# Altium schematic sheet SDIO_SDMMC_Sheet.SchDoc
size A4; DocumentNumber: 18; SheetNumber: 18; SheetTotal: 27
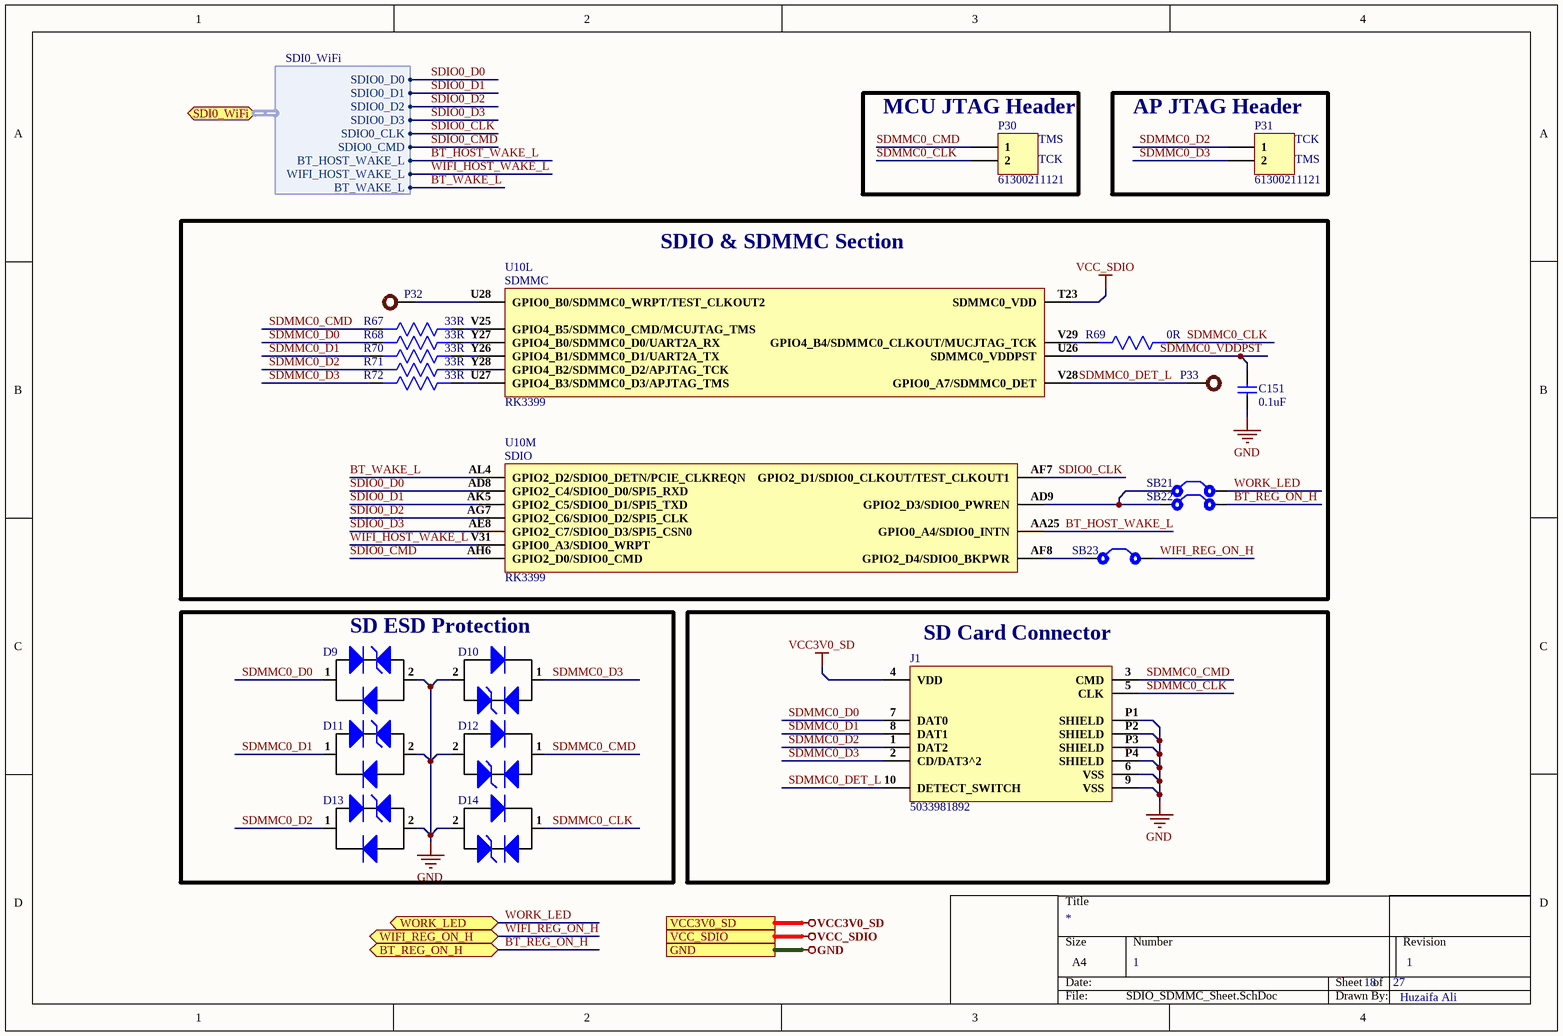
[diagram p0: SDIO_SDMMC_Sheet.SchDoc]

## Parts
C151  0.1uF  [Cap0402]
D9  ESD9X5VU  [DFN1006-2L]  (value not drawn)
D10  ESD9X5VU  [DFN1006-2L]  (value not drawn)
D11  ESD9X5VU  [DFN1006-2L]  (value not drawn)
D12  ESD9X5VU  [DFN1006-2L]  (value not drawn)
D13  ESD9X5VU  [DFN1006-2L]  (value not drawn)
D14  ESD9X5VU  [DFN1006-2L]  (value not drawn)
J1  5033981892  [503398-1892]
P30  61300211121  [HDR1X2]
P31  61300211121  [HDR1X2]
P32  Test Point  [TEST POINT]  (value not drawn)
P33  TEST POINT  [TEST POINT]  (value not drawn)
R67  33R  [Res0603]
R68  33R  [Res0603]
R69  0R  [Res0603]
R70  33R  [Res0603]
R71  33R  [Res0603]
R72  33R  [Res0603]
SB21  Solder Bridge  [Solder Bridge]  (value not drawn)
SB22  Solder Bridge  [Solder Bridge]  (value not drawn)
SB23  Solder Bridge  [Solder Bridge]  (value not drawn)
U10  RK3399  [RK3399]  (parts L,M of 34)

## Blocks framed on the sheet
MCU JTAG Header: P30
AP JTAG Header: P31
SDIO & SDMMC Section: C151 P32 P33 R67-R72 SB21-SB23 U10
SD ESD Protection: D9-D14
SD Card Connector: J1

## Ports
BT_REG_ON_H (bidir), GND, SDI0_WiFi (bidir, harness SDI0_WiFi), VCC3V0_SD, VCC_SDIO, WIFI_REG_ON_H (bidir), WORK_LED (bidir)

## Harnesses
SDI0_WiFi: SDIO0_D0, SDIO0_D1, SDIO0_D2, SDIO0_D3, SDIO0_CLK, SDIO0_CMD, BT_HOST_WAKE_L, WIFI_HOST_WAKE_L, BT_WAKE_L

## Nets
GND: C151.1 D9.2 D10.2 D11.2 D12.2 D13.2 D14.2 J1.6(VSS) J1.9(VSS) J1.P1(SHIELD) J1.P2(SHIELD) J1.P3(SHIELD) J1.P4(SHIELD) ; port GND
VCC3V0_SD: J1.4(VDD) ; port VCC3V0_SD
VCC_SDIO: U10.T23(SDMMC0_VDD) ; port VCC_SDIO
BT_HOST_WAKE_L: U10.AA25(GPIO0_A4/SDIO0_INTN) ; port SDI0_WiFi.BT_HOST_WAKE_L
BT_REG_ON_H: SB22.2 ; port BT_REG_ON_H
BT_WAKE_L: U10.AL4(GPIO2_D2/SDIO0_DETN/PCIE_CLKREQN) ; port SDI0_WiFi.BT_WAKE_L
SDIO0_CLK: U10.AF7(GPIO2_D1/SDIO0_CLKOUT/TEST_CLKOUT1) ; port SDI0_WiFi.SDIO0_CLK
SDIO0_CMD: U10.AH6(GPIO2_D0/SDIO0_CMD) ; port SDI0_WiFi.SDIO0_CMD
SDIO0_D0: U10.AD8(GPIO2_C4/SDIO0_D0/SPI5_RXD) ; port SDI0_WiFi.SDIO0_D0
SDIO0_D1: U10.AK5(GPIO2_C5/SDIO0_D1/SPI5_TXD) ; port SDI0_WiFi.SDIO0_D1
SDIO0_D2: U10.AG7(GPIO2_C6/SDIO0_D2/SPI5_CLK) ; port SDI0_WiFi.SDIO0_D2
SDIO0_D3: U10.AE8(GPIO2_C7/SDIO0_D3/SPI5_CSN0) ; port SDI0_WiFi.SDIO0_D3
SDMMC0_CLK: D14.1 J1.5(CLK) P30.2 R69.1
SDMMC0_CMD: D12.1 J1.3(CMD) P30.1 R67.2
SDMMC0_D0: D9.1 J1.7(DAT0) R68.2
SDMMC0_D1: D11.1 J1.8(DAT1) R70.2
SDMMC0_D2: D13.1 J1.1(DAT2) P31.1 R71.2
SDMMC0_D3: D10.1 J1.2(CD/DAT3^2) P31.2 R72.2
SDMMC0_DET_L: J1.10(DETECT_SWITCH) P33.1 U10.V28(GPIO0_A7/SDMMC0_DET)
SDMMC0_VDDPST: C151.2 U10.U26(SDMMC0_VDDPST)
WIFI_HOST_WAKE_L: U10.V31(GPIO0_A3/SDIO0_WRPT) ; port SDI0_WiFi.WIFI_HOST_WAKE_L
WIFI_REG_ON_H: SB23.2 ; port WIFI_REG_ON_H
WORK_LED: SB21.2 ; port WORK_LED
NetP32_1: P32.1 U10.U28(GPIO0_B0/SDMMC0_WRPT/TEST_CLKOUT2)
NetR67_1: R67.1 U10.V25(GPIO4_B5/SDMMC0_CMD/MCUJTAG_TMS)
NetR68_1: R68.1 U10.Y27(GPIO4_B0/SDMMC0_D0/UART2A_RX)
NetR69_2: R69.2 U10.V29(GPIO4_B4/SDMMC0_CLKOUT/MUCJTAG_TCK)
NetR70_1: R70.1 U10.Y26(GPIO4_B1/SDMMC0_D1/UART2A_TX)
NetR71_1: R71.1 U10.Y28(GPIO4_B2/SDMMC0_D2/APJTAG_TCK)
NetR72_1: R72.1 U10.U27(GPIO4_B3/SDMMC0_D3/APJTAG_TMS)
NetSB21_1: SB21.1 SB22.1 U10.AD9(GPIO2_D3/SDIO0_PWREN)
NetSB23_1: SB23.1 U10.AF8(GPIO2_D4/SDIO0_BKPWR)

## Notes on the sheet
- (near P30) TMS
- (near P30) TCK
- (near P31) TCK
- (near P31) TMS
- 1
- Huzaifa Ali
- (in symbol RK3399, part L) SDMMC
- (in symbol RK3399, part M) SDIO

## Library data of the parts
C151 = CC0402KRX5R6BB104: CAP CER 0.1UF 10V X5R 0402; Manufacturer: Yageo; Capacitance: 100nF; Tolerance: 10%; Dissipation Factor: 5%; Insulation Resistance: 10GR; Supplier 1: Digi-Key; Manufacturer Part Number: CC0402KRX5R6BB104; RoHS: Yes; Category: Ceramic Capacitors; Stock 1: 6385580; Pricing 1: 1=0.10000, 10=0.02700, 50=0.01500, 100=0.01220, 500=0.00874, 1000=0.00687, 2500=0.00625, 5000=0.00575 (USD); Mount: Surface Mount; Case/Package: 0402; Number of Pins: 2; Case Code (Imperial): 0402; Case Code (Metric): 1005; Min Operating Temperature: -55°C; Max Operating Temperature: 85°C; Dielectric: X5R; Packaging: Tape and Reel; Voltage Rating: 10V; Package Quantity: 1; Termination: SMD/SMT; Voltage Rating (DC): 10V; Series: CC; Length: 1mm; Width: 0.02inch; Height: 0.5mm; Depth: 0.5mm; Thickness: 0.022inch; Radiation Hardening: No; RoHS Compliant: Yes; REACH SVHC: No SVHC; Lead Free: Lead Free; Halogen Free: Halogen Free; ComponentLink1URL: https://datasheet.ciiva.com/144/mlccorderingcode-144029.pdf?src-supplier=Digi-Key; ComponentLink1Description: https://datasheet.ciiva.com/144/mlccorderingcode-144029.pdf?src-supplier=Digi-Key; ComponentLink2URL: https://datasheet.ciiva.com/144/mlccorderingcode-144028.pdf?src-supplier=Digi-Key; ComponentLink2Description: https://datasheet.ciiva.com/144/mlccorderingcode-144028.pdf?src-supplier=Digi-Key; ComponentLink3URL: https://datasheet.ciiva.com/144/mlccorderingcode-144030.pdf?src-supplier=Digi-Key; ComponentLink3Description: https://datasheet.ciiva.com/144/mlccorderingcode-144030.pdf?src-supplier=Digi-Key; ComponentLink4URL: https://datasheet.ciiva.com/7978/1359354-7978091.pdf?src-supplier=Element14; ComponentLink4Description: https://datasheet.ciiva.com/7978/1359354-7978091.pdf?src-supplier=Element14; ComponentLink5URL: https://datasheet.ciiva.com/11587/upy-gphc-x5r-4v-to-50v-12-11587302.pdf?src-supplier=Avnet; ComponentLink5Description: https://datasheet.ciiva.com/11587/upy-gphc-x5r-4v-to-50v-12-11587302.pdf?src-supplier=Avnet; Supplier Part Number 1: 311-1336-1-ND
D9-D14 = ESD9X5VU: DFN1006-2 ESD Protection Devices ROHS; Manufacturer: TECH PUBLIC; Manufacturer Part Number: ESD9X5VU; Footprint: DFN1006-2; ComponentLink1Description: LCSC; ComponentLink1URL: https://www.lcsc.com/product-detail/span-style-background-color-ff0-ESD-span-Protection-Devices_TECH-PUBLIC-ESD9X5VU_C2875160.html
J1 = 5033981892: MICRO SD PUSH/PUSH SMALL 8C; Manufacturer: Molex; Supplier 1: Arrow Electronics; Manufacturer Part Number: 503398-1892; RoHS: Yes; Category: Memory Connectors; Stock 1: 14535; Pricing 1: 1=2.47900, 10=2.18900, 25=2.17400, 100=1.81200 (USD); ComponentLink1URL: https://datasheet.ciiva.com/29723/5033981892-sd-29723401.pdf?src-supplier=Digi-Key; ComponentLink1Description: https://datasheet.ciiva.com/29723/5033981892-sd-29723401.pdf?src-supplier=Digi-Key; ComponentLink2URL: https://datasheet.ciiva.com/22744/1740946-22744573.pdf?src-supplier=Element14; ComponentLink2Description: https://datasheet.ciiva.com/22744/1740946-22744573.pdf?src-supplier=Element14; ComponentLink3URL: https://datasheet.ciiva.com/23941/1740947-23941665.pdf?src-supplier=Newark; ComponentLink3Description: https://datasheet.ciiva.com/23941/1740947-23941665.pdf?src-supplier=Newark; Supplier Part Number 1: 503398-1892
P30 P31 = 61300211121: CONN HEADER VERT 2POS 2.54MM; Manufacturer: Wurth Electronics; Current Rating: 3A; Voltage Rating: 250V; Number of Positions: 2; Gender: Male; Connector Type: Male Pin; Pitch: 0.1inch; Supplier 1: Digi-Key; Manufacturer Part Number: 61300211121; Stock 1: 219205; Pricing 1: 1=0.13, 10=0.106, 25=0.088, 50=0.074, 100=0.067, 1000=0.061 (USD); Mount: Through Hole; Contact Plating: Gold; Housing Material: PBT; Contact Material: Copper Alloy,Copper; Color: Black; Min Operating Temperature: -40°C; Max Operating Temperature: 125°C; Number of Rows: 1; Contact Gender: Male; Packaging: Bulk; Termination: Through Hole; Number of Contacts: 2; Contact Mating Length: 0.236inch; REACH SVHC: Unknown; Lead Free: Lead Free; ComponentLink1URL: http://www.mouser.com/ds/2/445/6130xx11121-538006.pdf?src-supplier=Mouser; ComponentLink1Description: http://www.mouser.com/ds/2/445/6130xx11121-538006.pdf?src-supplier=Mouser; Supplier Part Number 1: 732-5315-ND
P32 P33 = TEST POINT: Test Point ON
R67 R68 R70-R72 = RC0603FR-0733RL: RES SMD 33 OHM 1% 1/10W 0603; Manufacturer: Yageo; Temperature Coefficient: 100ppm/°C; Voltage Rating (DC): 50V; Power Rating: 100mW; Voltage Rating: 75V; Supplier 1: Digi-Key; Manufacturer Part Number: RC0603FR-0733RL; Stock 1: 5529439; Pricing 1: 1=0.1, 10=0.023, 100=0.0094, 1000=0.00421, 2500=0.00366 (USD); Case/Package: 0603; Number of Pins: 2; Weight: 7.1E-05oz; Case Code (Metric): 1608; Case Code (Imperial): 0603; Min Operating Temperature: -55°C; Max Operating Temperature: 155°C; Resistance: 33R; Tolerance: 1%; Composition: Thick Film; Packaging: Tape and Reel; Package Quantity: 1; Number of Terminations: 2; Termination: SMD/SMT; Military Standard: Not; Max Power Dissipation: 100mW; Features: Moisture Resistant; Length: 1.6mm; Height: 0.45mm; Width: 0.8mm; Depth: 0.8mm; Lead Pitch: 0.3mm; REACH SVHC: No SVHC; Lead Free: Lead Free; ComponentLink1URL: http://www.yageo.com/documents/recent/PYu-RC_Group_51_RoHS_L_10.pdf?src-supplier=Digi-Key; ComponentLink1Description: http://www.yageo.com/documents/recent/PYu-RC_Group_51_RoHS_L_10.pdf?src-supplier=Digi-Key; ComponentLink2URL: http://documents.rs-components.com/techlib://itc_doclist_GB.htm?stockno=5046562&src-supplier=RSComponents; ComponentLink2Description: http://documents.rs-components.com/techlib://itc_doclist_GB.htm?stockno=5046562&src-supplier=RSComponents; ComponentLink3URL: http://www.farnell.com/datasheets/38590.pdf?src-supplier=Element14; ComponentLink3Description: http://www.farnell.com/datasheets/38590.pdf?src-supplier=Element14; ComponentLink4URL: https://www.verical.com/server-webapp/html/getDatasheet?partID=326673&src-supplier=Verical; ComponentLink4Description: https://www.verical.com/server-webapp/html/getDatasheet?partID=326673&src-supplier=Verical; ComponentLink5URL: http://www.farnell.com/datasheets/1868787.pdf?src-supplier=Element14; ComponentLink5Description: http://www.farnell.com/datasheets/1868787.pdf?src-supplier=Element14; ComponentLink6URL: http://www.farnell.com/datasheets/2167052.pdf?src-supplier=Element14; ComponentLink6Description: http://www.farnell.com/datasheets/2167052.pdf?src-supplier=Element14; ComponentLink7URL: http://www.farnell.com/datasheets/443971.pdf?src-supplier=Element14; ComponentLink7Description: http://www.farnell.com/datasheets/443971.pdf?src-supplier=Element14; Supplier Part Number 1: 311-33.0HRCT-ND
R69 = RC0603FR-070RL: RES SMD 0R, 1%, 0.1W, 0603; Manufacturer: Yageo; Resistance: 0mR; Power Rating: 100mW; Voltage Rating (DC): 50V; Temperature Coefficient: 200ppm/°C; Current Rating: 1A; Working Voltage: 75V; Supplier 1: Arrow Electronics; Manufacturer Part Number: RC0603FR-070RL; RoHS: Yes; Category: Chip SMD Resistors; Stock 1: 1270000; Pricing 1: 5000=0.00320, 5000=0.00490, 50000=0.00450, 500000=0.00250, 2500000=0.00150 (USD); Case/Package: 0603; Number of Pins: 2; Contact Plating: Tin,Matte; Case Code (Metric): 1608; Case Code (Imperial): 0603; Min Operating Temperature: -55°C; Max Operating Temperature: 155°C; Resistor Type: Thick Film; Packaging: Tape and Reel; Tolerance: 1%; Package Quantity: 5000; Voltage Rating: 50V; Number of Terminations: 2; Termination: SMD/SMT; Max Power Dissipation: 100mW; Features: Moisture Resistant; Length: 1.6mm; Width: 0.031inch; Height: 0.45mm; Depth: 0.8mm; Radiation Hardening: No; REACH SVHC: No SVHC; Lead Free: Lead Free; Military Standard: Not; ComponentLink1URL: https://datasheet.ciiva.com/11808/0900766b80f96399-11808172.pdf?src-supplier=RSComponents; ComponentLink1Description: https://datasheet.ciiva.com/11808/0900766b80f96399-11808172.pdf?src-supplier=RSComponents; ComponentLink2URL: https://datasheet.ciiva.com/5558/rc0603-272842-5558341.pdf?src-supplier=Mouser; ComponentLink2Description: https://datasheet.ciiva.com/5558/rc0603-272842-5558341.pdf?src-supplier=Mouser; ComponentLink3URL: https://datasheet.ciiva.com/46382/443971-46382072.pdf?src-supplier=Element14; ComponentLink3Description: https://datasheet.ciiva.com/46382/443971-46382072.pdf?src-supplier=Element14; ComponentLink4URL: https://datasheet.ciiva.com/29721/pyu-r-int-thick-7-29721178.pdf?src-supplier=Digi-Key; ComponentLink4Description: https://datasheet.ciiva.com/29721/pyu-r-int-thick-7-29721178.pdf?src-supplier=Digi-Key; ComponentLink5URL: https://datasheet.ciiva.com/5684/443971-5684699.pdf?src-supplier=Farnell; ComponentLink5Description: https://datasheet.ciiva.com/5684/443971-5684699.pdf?src-supplier=Farnell; ComponentLink6URL: https://datasheet.ciiva.com/7983/443971-7983627.pdf?src-supplier=Element14; ComponentLink6Description: https://datasheet.ciiva.com/7983/443971-7983627.pdf?src-supplier=Element14; ComponentLink7URL: https://datasheet.ciiva.com/29721/pyu-rc0603-51-rohs-l-4-29721179.pdf?src-supplier=Digi-Key; ComponentLink7Description: https://datasheet.ciiva.com/29721/pyu-rc0603-51-rohs-l-4-29721179.pdf?src-supplier=Digi-Key; ComponentLink8URL: https://datasheet.ciiva.com/22643/1868787-22643388.pdf?src-supplier=Element14; ComponentLink8Description: https://datasheet.ciiva.com/22643/1868787-22643388.pdf?src-supplier=Element14; Supplier Part Number 1: RC0603FR-070RL
SB21-SB23 = Solder Bridge: Solder Bridge ON
U10 = RK3399: RK3399 CPU BGA for HD set-top box chip BGA Chipse; Manufacturer: Fuzhou Rockchip Electronics; ComponentLink1Description: Aliexpress; ComponentLink1URL: https://www.aliexpress.com/item/1005001971093459.html?spm=a2g0n.productlist.0.0.3c7csv8Qsv8Quh&browser_id=3ac7e9efb8074641aaabc4d871f09748&aff_trace_key=&aff_platform=msite&m_page_id=181389a08711fc2600d8cc522bab8d702dd4189be0&gclid=&pdp_npi=2%40dis%21USD%21%2123.6%21%21%21%21%21%402101d91e16545120399167831e8b89%21%21sea&algo_pvid=4303aedd-774c-4013-953d-920f10b55003; Manufacturer Part Number: RK3399; Footprint: FCBGA828